# EAGLE design 2teLEDTASTER_1 (EAGLE 5.04)
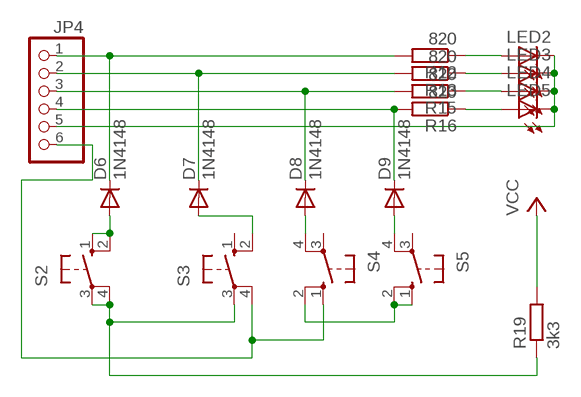
[diagram p0: schematic, sheet 1]

## Parts
D6  1N4148  [DO35-10]
D7  1N4148  [DO35-10]
D8  1N4148  [DO35-10]
D9  1N4148  [DO35-10]
JP4  PINHD-1X6  [1X06]
LED2  LED3MM  [LED3MM]
LED3  LED3MM  [LED3MM]
LED4  LED3MM  [LED3MM]
LED5  LED3MM  [LED3MM]
R12  820  R-EU_0207/10  [0207/10]
R13  820  R-EU_0207/10  [0207/10]
R15  820  R-EU_0207/10  [0207/10]
R16  820  R-EU_0207/10  [0207/10]
R19  3k3  R-EU_0207/10  [0207/10]
S2  10-XX  [B3F-10XX]
S3  10-XX  [B3F-10XX]
S4  10-XX  [B3F-10XX]
S5  10-XX  [B3F-10XX]

## Nets
N$3: D8.A S4.4(P1)
N$6: D9.A S5.4(P1)
N$16: D6.C JP4.1 R12.2
N$17: D7.C JP4.2 R13.2
N$18: D8.C JP4.3 R15.2
N$19: D9.C JP4.4 R16.2
N$20: LED2.A R12.1
N$21: LED3.A R13.1
N$22: LED4.A R15.1
N$23: LED5.A R16.1
N$24: JP4.5 LED2.K(C) LED3.K(C) LED4.K(C) LED5.K(C)
N$27: S4.2(S1) S5.1(S) S5.2(S1)
N$35: R19.1 S2.3(P) S2.4(P1) S3.3(P)
N$36: D6.A S2.1(S) S2.2(S1)
N$37: D7.A S3.2(S1)
N$40: JP4.6 S3.4(P1) S4.1(S)
VCC: R19.2
Unconnected: S3.1(S) S4.3(P) S5.3(P)

## Library data of the parts
D6-D9 = diode:1N4148: DIODE high speed (Philips)
JP4 = pinhead:PINHD-1X6: PIN HEADER
LED2-LED5 = led:LED: LED OSRAM: - CHIPLED LG R971, LG N971, LY N971, LG Q971, LY Q971, LO R971, LY R971 LH N974, LH R974 LS Q976, LO Q976, LY Q976 LO Q996 - Hyper CHIPLED LW Q18S LB Q993, LB Q99A, LB R99A - SideLED LS A670, LO A670, LY A670, LG A670, LP A670 LB A673, LV A673, LT A673, LW A673 LH A674 LY A675 LS A676, LA A676, LO A676, LY A676, LW A676 LS A679, LY A679, LG A679 - Hyper Micro SIDELED® LS Y876, LA Y876, LO Y876, LY Y876 LT Y87S - SmartLED LW L88C, LW L88S LB L89C, LB L89S, LG L890 LS L89K, LO L89K, LY L89K LS L896, LA L896, LO L896, LY L896 - TOPLED LS T670, LO T670, LY T670, LG T670, LP T670 LSG T670, LSP T670, LSY T670, LOP T670, LYG T670 LG T671, LOG T671, LSG T671 LB T673, LV T673, LT T673, LW T673 LH T674 LS T676, LA T676, LO T676, LY T676, LB T676, LH T676, LSB T676, LW T676 LB T67C, LV T67C, LT T67C, LS T67K, LO T67K, LY T67K, LW E67C LS E67B, LA E67B, LO E67B, LY E67B, LB E67C, LV E67C, LT E67C LW T67C LS T679, LY T679, LG T679 LS T770, LO T770, LY T770, LG T770, LP T770 LB T773, LV T773, LT T773, LW T773 LH T774 LS E675, LA E675, LY E675, LS T675 LS T776, LA T776, LO T776, LY T776, LB T776 LHGB T686 LT T68C, LB T68C - Hyper Mini TOPLED® LB M676 - Mini TOPLED Santana® LG M470 LS M47K, LO M47K, LY M47K Source: http://www.osram.convergy.de - LUMILED® LXK2-PW12-R00, LXK2-PW12-S00, LXK2-PW14-U00, LXK2-PW14-V00 LXK2-PM12-R00, LXK2-PM12-S00, LXK2-PM14-U00 LXK2-PE12-Q00, LXK2-PE12-R00, LXK2-PE12-S00, LXK2-PE14-T00, LXK2-PE14-U00 LXK2-PB12-K00, LXK2-PB12-L00, LXK2-PB12-M00, LXK2-PB14-N00, LXK2-PB14-P00, LXK2-PB14-Q00 LXK2-PR12-L00, LXK2-PR12-M00, LXK2-PR14-Q00, LXK2-PR14-R00 LXK2-PD12-Q00, LXK2-PD12-R00, LXK2-PD12-S00 LXK2-PH12-R00, LXK2-PH12-S00 LXK2-PL12-P00, LXK2-PL12-Q00, LXK2-PL12-R00 Source: www.luxeon.com
R12 R13 R15 R16 R19 = rcl:R-EU_: RESISTOR, European symbol
S2-S5 = switch-omron:10-XX: OMRON SWITCH

## Board
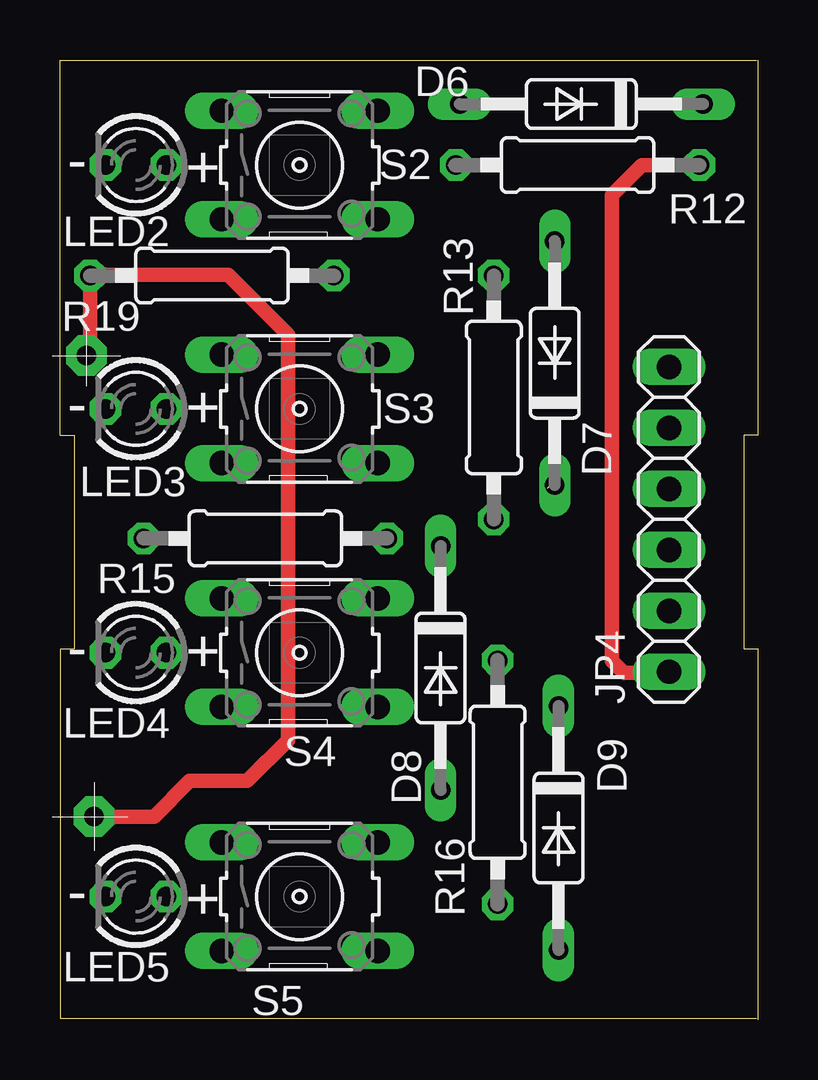
[diagram p1: board, top side]
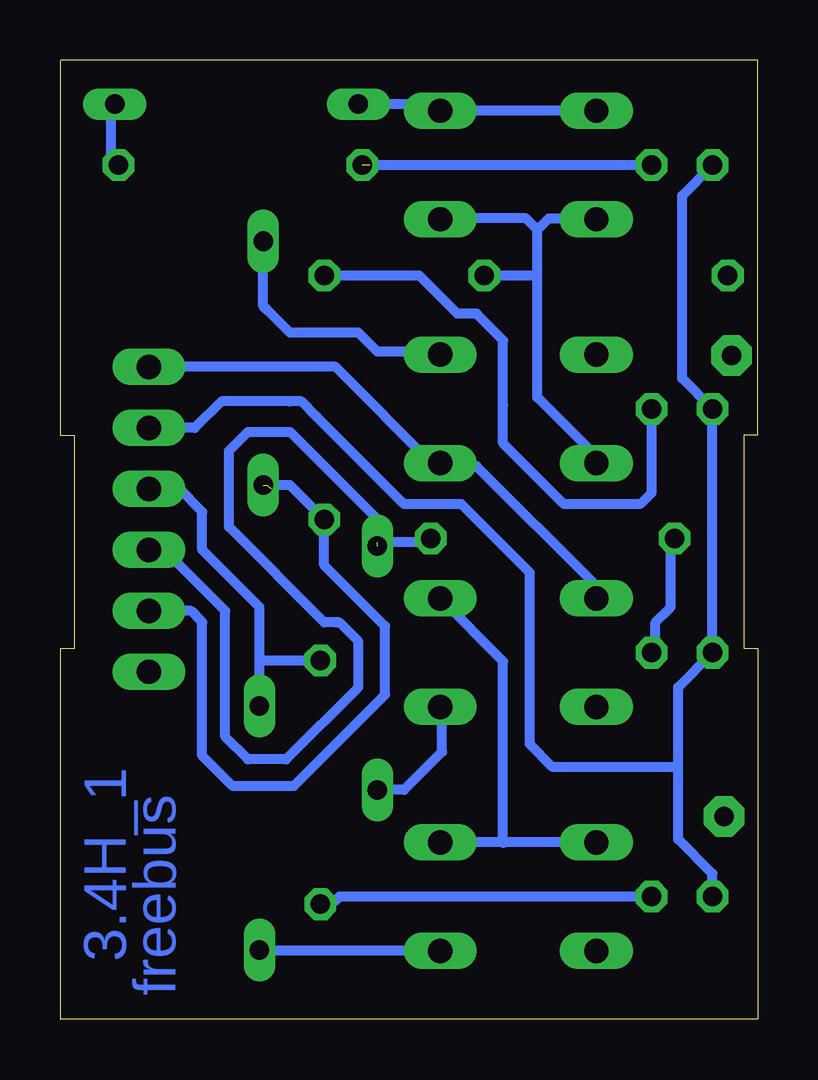
[diagram p2: board, bottom side, seen from below]

Size 29.1 x 40 mm. Coordinates in mm from the lower left corner, seen from the top.
Outline: 0,40 29.05,40
Outline: 29.1,40 29.1,24.36 28.5,24.36 28.5,15.46 29.1,15.46 29.1,0
Outline: 29.05,0.06 0,0.06 0,15.46 0.6,15.46 0.6,24.36 0,24.36 0,40
Copper layers (1*16): Top 0.035mm / dielectric 1.5mm / Bottom 0.035mm
Design rules "default": minimum track width 10mil, minimum drill 24mil, track to track 8mil, track to pad 8mil, pad to pad 8mil, via to via 8mil, smd to smd 8mil, copper to edge 40mil, drill to drill 8mil, minimum pad ring 10mil, minimum via ring 8mil, stop-mask expansion 4mil, vias tented up to drill 0mil, thermal gap 10mil

### Footprints (pad centres in the part's own frame; a part is rotated, then mirrored left to right if it is on the bottom)
DO35-10 = drill 0.813 long: A 5.08,0; C -5.08,0
1X06 = drill 1.016 long: 1 -6.35,0; 2 -3.81,0; 3 -1.27,0; 4 1.27,0; 5 3.81,0; 6 6.35,0
LED3MM = drill 0.813 octagon: A -1.27,0; K 1.27,0
0207/10 = drill 0.813 octagon: 1 -5.08,0; 2 5.08,0
B3F-10XX = drill 1.016 long: 1 -3.251,2.261; 2 3.251,2.261; 3 -3.251,-2.261; 4 3.251,-2.261

### Placement (x,y rotation side)
D6  21.74,38.16 180 top
D7  20.63,27.37 90 top
D8  15.87,14.67 270 top
D9  20.79,8 270 top
JP4  25.39,20.86 90 top
LED2  3.16,35.62 180 top
LED3  3.16,25.46 180 top
LED4  3.16,15.3 180 top
LED5  3.16,5.14 180 top
R12  21.58,35.62 0 top
R13  18.09,25.94 270 top
R15  8.56,20.06 0 top
R16  18.25,9.9 90 top
R19  6.34,31.02 180 top
S2  9.99,35.62 0 top
S3  9.99,25.46 0 top
S4  9.99,15.3 0 top
S5  9.99,5.14 0 top

### Tracks (layer width: path | path; a pad name or v marks a point on that pad's centre or on a via)
N$3
  Bottom 0.406: D8.A 14.75,9.59 13.17,11.17 13.17,13.08 13.2,13.04 S4.4
N$6
  Bottom 0.406: D9.A 20.63,2.92 20.59,2.88 S5.4
N$16  (1 unrouted)
  Top 0.61: R12.2 24.26,35.62 23,34.36 23,14.96 23.5,14.46 25.34,14.46 JP4.1
  Bottom 0.406: D6.C 26.98,38.16 26.98,35.94 R12.2
N$17  (2 unrouted)
  Bottom 0.406: JP4.2 23.64,17.05 23.17,16.57 23.17,11.02 21.9,9.75 19.36,9.75 15.55,13.56 15.55,16.41 18.09,18.95 R13.2 19.52,22.29 20.47,22.29 | 20.31,22.13
N$18  (1 unrouted)
  Bottom 0.406: R15.2 14.12,19.91 15.87,19.91 | 15.87,20.86 19.52,24.51 20.15,24.51 21.26,24.51 22.06,23.72 22.06,20.54 18.09,16.57 17.61,16.57 17.45,16.57 16.66,15.78 16.66,13.87 19.68,10.86 21.26,10.86 22.22,11.81 22.22,17.05 24.6,19.43 25.23,19.43 JP4.3 | D8.C | 15.87,20.86 | 15.87,20.86 D8.C
N$19
  Bottom 0.406: JP4.4 24.12,22.13 23.17,21.18 23.17,19.59 20.79,17.21 20.79,14.98 | R16.2 | 20.79,14.98 R16.2 | 20.79,14.98 | D9.C 20.79,14.98 | 20.79,14.98
N$20  (1 unrouted)
  Bottom 0.406: LED2.A 16.18,35.62
N$21
  Bottom 0.406: LED3.A | LED3.A 4.44,21.97 4.91,21.49 8.09,21.49 10.63,24.03 10.63,25.62 | 10.63,25.62 10.63,28.32 11.74,29.43 12.53,29.43 14.12,31.02 R13.1 | 10.63,25.62
N$22
  Bottom 0.406: R15.1 3.64,20.22 3.64,17.21 4.28,16.57 4.28,15.46 LED4.A
N$23
  Bottom 0.406: LED5.A 4.44,5.3 4.59,5.14 17.45,5.14 17.61,4.98 18.25,4.98 R16.1
N$24
  Bottom 0.406: LED2.K 3.17,34.35 3.17,26.73 LED3.K LED4.K 3.32,13.87 3.32,10.54 | 3.32,10.54 3.32,7.52 1.9,6.09 LED5.K | LED5.K | JP4.5 23.49,24.67 22.37,25.78 19.52,25.78 19.04,25.78 18.41,25.14 14.75,21.49 12.37,21.49 9.52,18.64 9.52,11.49 8.56,10.54 3.32,10.54
N$27
  Bottom 0.406: S5.1 10.63,7.4 | 10.63,7.4 S5.2 13.29,7.4 13.33,7.36 | S4.2 10.63,14.95 10.63,7.4 | 10.63,7.4 10.63,7.36
N$35
  Bottom 0.406: S3.3 6.74,23.48 9.2,25.94 9.2,31.02 | 9.2,31.02 9.2,32.92 | 9.2,32.92 9.67,33.4 13.17,33.4 13.2,33.36 S2.4 | 9.2,32.92 | 9.2,32.92 8.72,33.4 6.82,33.4 6.78,33.36 S2.3 | R19.1 | 9.2,31.02 R19.1
N$36  (1 unrouted)
  Bottom 0.406: 13.48,37.84 13.45,37.88 S2.2 13.29,37.88 | 13.48,37.84 | S2.1 13.29,37.88 | 13.29,37.88 13.33,37.84 | 13.48,37.84 13.8,38.16 D6.A
N$37
  Bottom 0.406: S3.2 13.33,27.8 13.33,27.84 15.87,27.84 16.66,28.64 19.52,28.64 20.47,29.59 | 20.47,29.59 | D7.A 20.63,29.75 20.47,29.59
N$40
  Bottom 0.406: JP4.6 17.61,27.21 13.48,23.08 13.36,23.08 S3.4 13.24,23.16 13.33,23.08 11.74,23.08 | S4.1 6.74,18.08 11.74,23.08 | 11.74,23.08
VCC  (via drill 0.8 pad 1.68)
  Top 0.61: v1.1,27.68 1.26,27.84 R19.2 1.3,31.06 7,31.06 9.5,28.56 9.5,11.66 7.8,9.96 5.4,9.96 3.92,8.48 v1.42,8.48

### Text on the board
Bottom: 3.4H_1 | freebus
tPlace: - | + | - | + | - | + | - | +